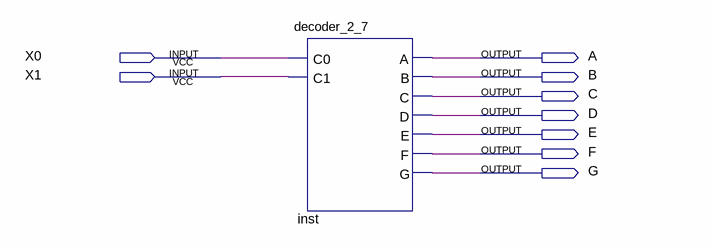
[diagram p0: schematic sheet]
// Quartus schematic lab5.bdf as structural Verilog: 1 symbols, 9 pins
module lab5 (
  input  X0,
  input  X1,
  output A,
  output B,
  output C,
  output D,
  output E,
  output F,
  output G
);

  decoder_2_7 inst (.C0(X0), .C1(X1), .A(A), .B(B), .C(C), .D(D), .E(E), .F(F), .G(G));
endmodule
